# Altium schematic sheet DC116A_AFE4950.SchDoc: AFE
size 431 x 279 mm; Date: Not shown in title block; ApprovedBy: Not shown in title block; CheckedBy: Not shown in title block; Author: Not shown in title block; CompanyName: Not shown in title block; DrawnBy: Midhun Raveendran; Engineer: Midhun Raveendran; Organization: Not shown in title block; Address1: Not shown in title block; Address2: Not shown in title block; Address3: Not shown in title block; Address4: Not shown in title block; DocumentNumber: 2; Revision: Use project parameter SCH_Rev; SheetNumber: 2; SheetTotal: 8; PageSetup: Record=PageOptions|CenterHorizontal=True|CenterVertical=True|PrintScale=1.00|XCorrection=1.00|YCorrection=1.00|PrintKind=0|BorderSize=5000000|LeftOffset=0|BottomOffset=0|Orientation=2|PaperLength=1000|PaperWidth=1000|Scale=100|PaperSource=15|PrintQuality=600|MediaType=1|DitherType=10|PaperKind=Letter|PrintScaleMode=1; CurrentTime: Not shown in title block; CurrentDate: Not shown in title block; Time: Not shown in title block; DocumentFullPathAndName: Not shown in title block; DocumentName: Not shown in title block; ModifiedDate: Not shown in title block; ImagePath: Not shown in title block
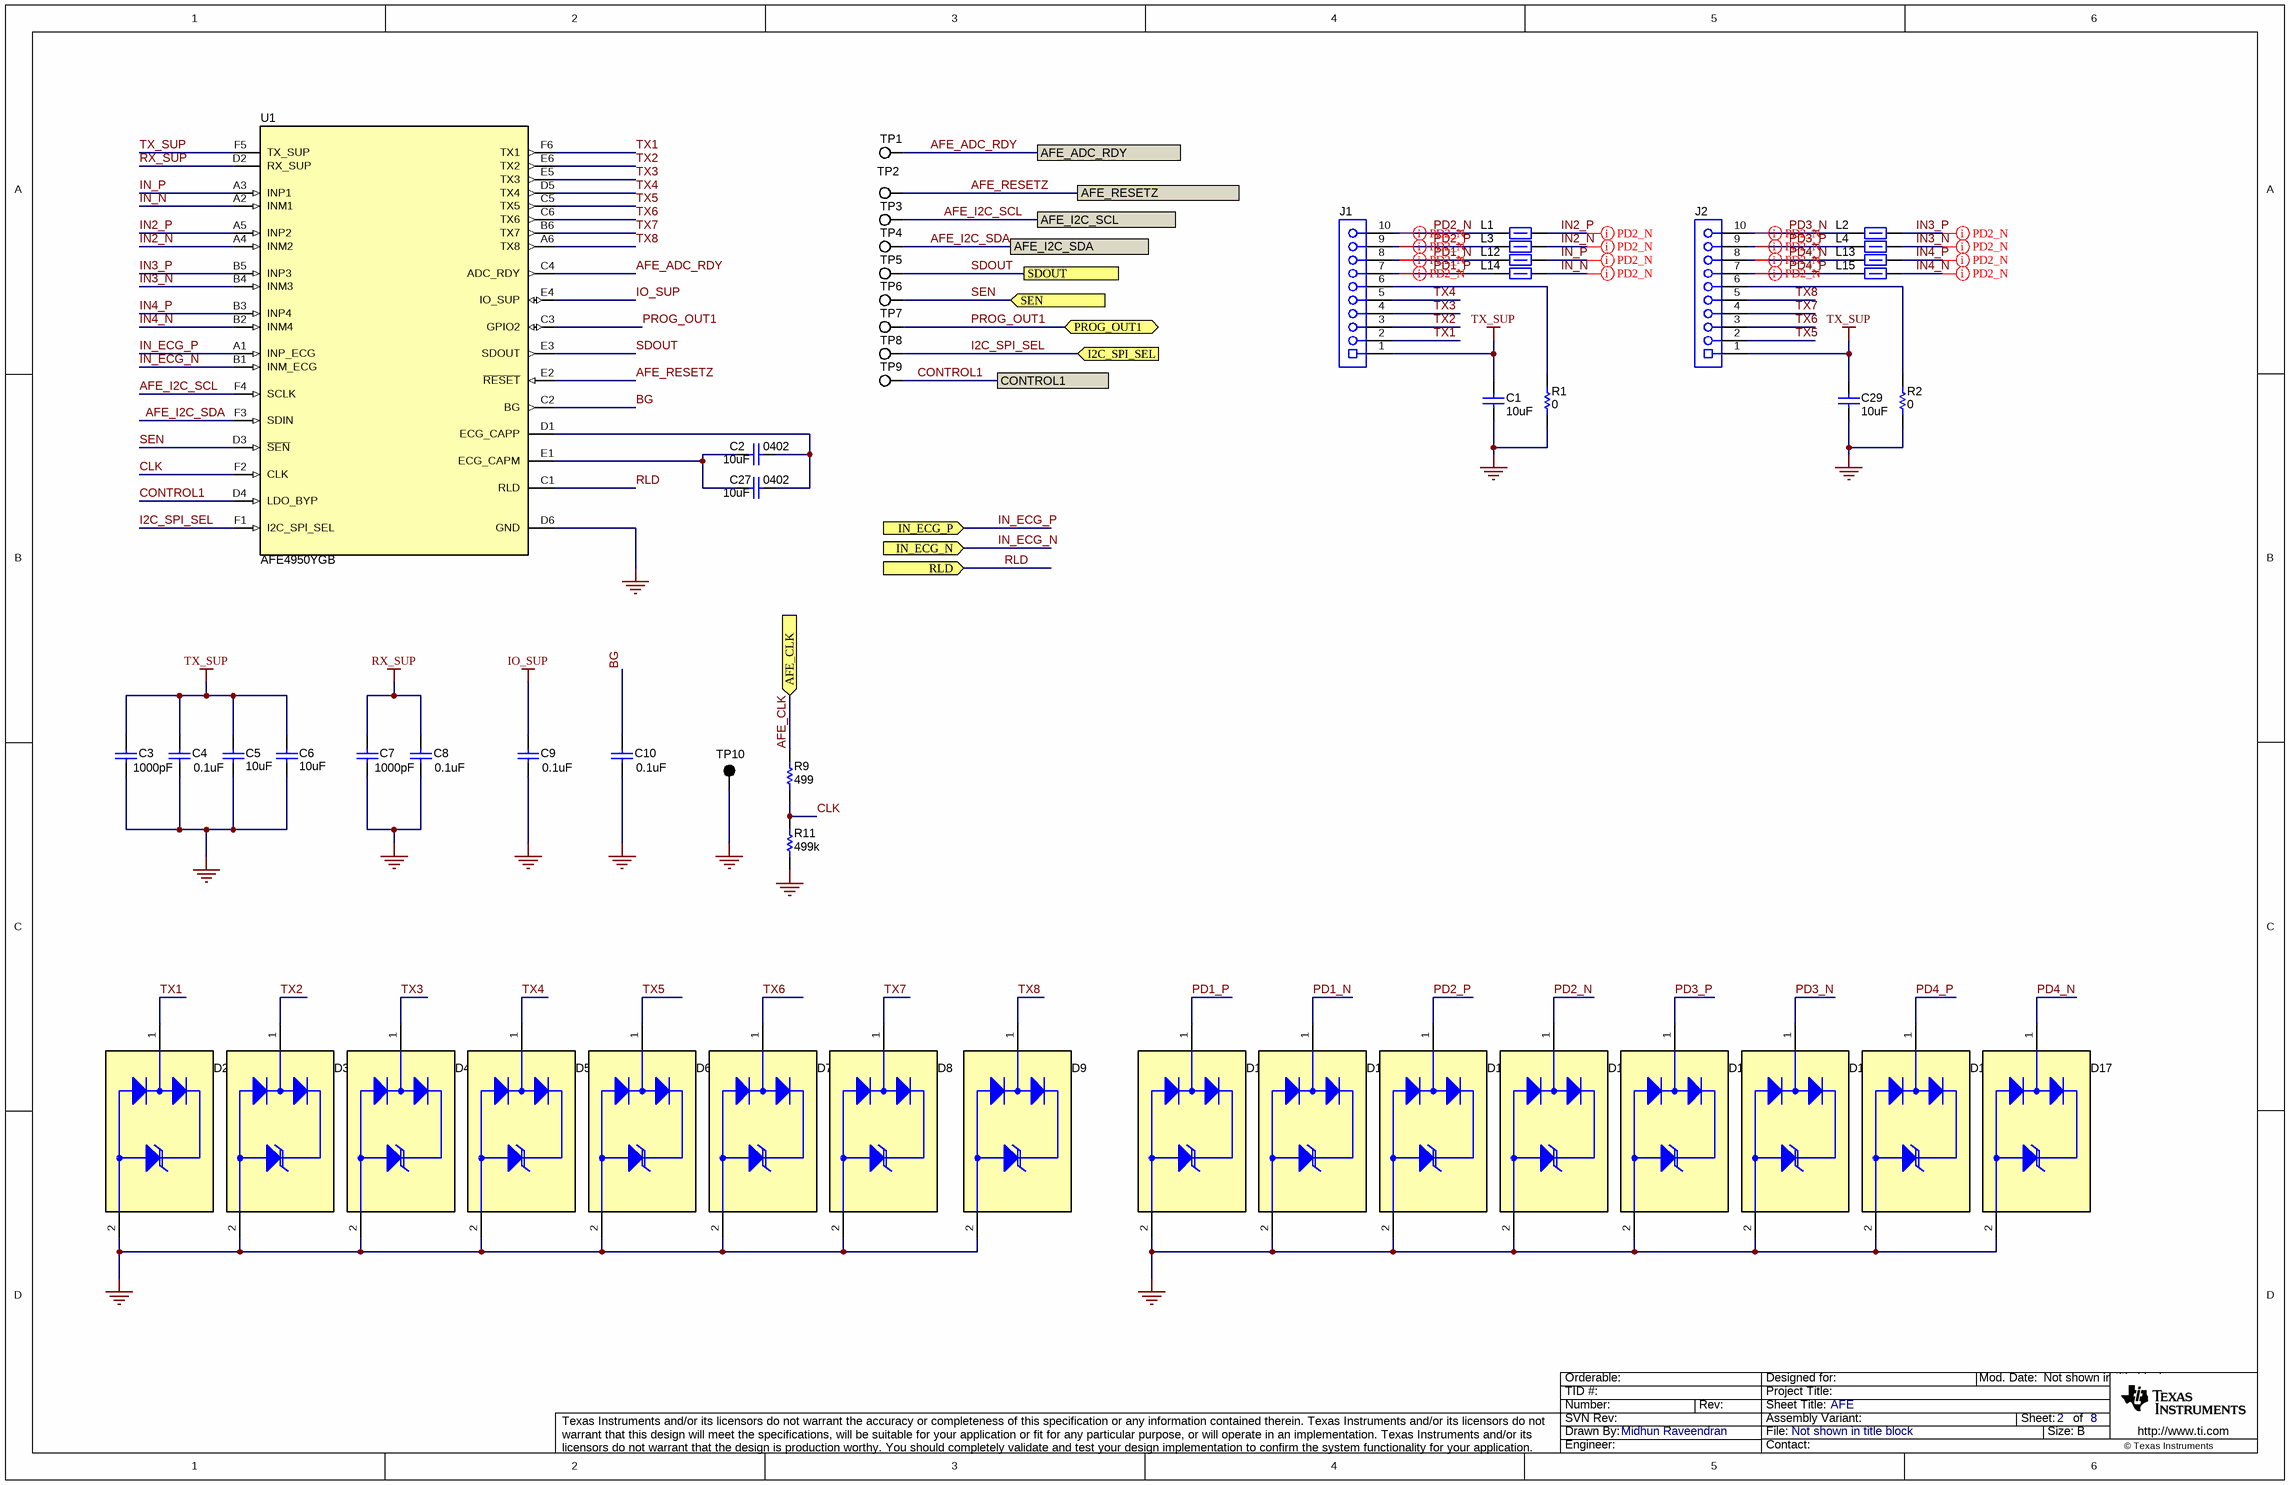
[diagram p0: DC116A_AFE4950.SchDoc]

## Parts
C1  ValueDisplayed: 10uF  [0603]  (hidden comment: Capacitor)
C2  Cap_Case: 0402  ValueDisplayed: 10uF  [0402_070]  (hidden comment: GRM155R60J106ME44D)
C3  ValueDisplayed: 1000pF  [0402]  (hidden comment: C1005X7R1H102M050BE)
C4  ValueDisplayed: 0.1uF  [0402]  (hidden comment: 0402YC104KAT2A)
C5  ValueDisplayed: 10uF  [0603]  (hidden comment: Capacitor)
C6  ValueDisplayed: 10uF  [0603]  (hidden comment: Capacitor)
C7  ValueDisplayed: 1000pF  [0402]  (hidden comment: C1005X7R1H102M050BE)
C8  ValueDisplayed: 0.1uF  [0402]  (hidden comment: 0402YC104KAT2A)
C9  ValueDisplayed: 0.1uF  [0402]  (hidden comment: 0402YC104KAT2A)
C10  ValueDisplayed: 0.1uF  [0402]  (hidden comment: 0402YC104KAT2A)
C27  Cap_Case: 0402  ValueDisplayed: 10uF  [0402_070]  (hidden comment: GRM155R60J106ME44D)
C29  ValueDisplayed: 10uF  [0603]  (hidden comment: Capacitor)
D2  TPD1E04U04DPYR  [DPY0002A]  (value not drawn)
D3  TPD1E04U04DPYR  [DPY0002A]  (value not drawn)
D4  TPD1E04U04DPYR  [DPY0002A]  (value not drawn)
D5  TPD1E04U04DPYR  [DPY0002A]  (value not drawn)
D6  TPD1E04U04DPYR  [DPY0002A]  (value not drawn)
D7  TPD1E04U04DPYR  [DPY0002A]  (value not drawn)
D8  TPD1E04U04DPYR  [DPY0002A]  (value not drawn)
D9  TPD1E04U04DPYR  [DPY0002A]  (value not drawn)
D10  TPD1E04U04DPYR  [DPY0002A]  (value not drawn)
D11  TPD1E04U04DPYR  [DPY0002A]  (value not drawn)
D12  TPD1E04U04DPYR  [DPY0002A]  (value not drawn)
D13  TPD1E04U04DPYR  [DPY0002A]  (value not drawn)
D14  TPD1E04U04DPYR  [DPY0002A]  (value not drawn)
D15  TPD1E04U04DPYR  [DPY0002A]  (value not drawn)
D16  TPD1E04U04DPYR  [DPY0002A]  (value not drawn)
D17  TPD1E04U04DPYR  [DPY0002A]  (value not drawn)
J1  Receptacle_10x1  [CONN_851-43-010-20-001000]  (value not drawn)
J2  Receptacle_10x1  [CONN_851-43-010-20-001000]  (value not drawn)
L1  MMZ1005S182ET000  [MMZ1005-E]  (value not drawn)
L2  MMZ1005S182ET000  [MMZ1005-E]  (value not drawn)
L3  MMZ1005S182ET000  [MMZ1005-E]  (value not drawn)
L4  MMZ1005S182ET000  [MMZ1005-E]  (value not drawn)
L12  MMZ1005S182ET000  [MMZ1005-E]  (value not drawn)
L13  MMZ1005S182ET000  [MMZ1005-E]  (value not drawn)
L14  MMZ1005S182ET000  [MMZ1005-E]  (value not drawn)
L15  MMZ1005S182ET000  [MMZ1005-E]  (value not drawn)
R1  ValueDisplayed: 0  [0201]  (hidden comment: Resistor)
R2  ValueDisplayed: 0  [0201]  (hidden comment: Resistor)
R9  ValueDisplayed: 499  [0402]  (hidden comment: Resistor)
R11  ValueDisplayed: 499k  [0402]  (hidden comment: Resistor)
TP1  5002  [Keystone5002]  (value not drawn)
TP2  5002  [Keystone5002]  (value not drawn)
TP3  5002  [Keystone5002]  (value not drawn)
TP4  5002  [Keystone5002]  (value not drawn)
TP5  5002  [Keystone5002]  (value not drawn)
TP6  5002  [Keystone5002]  (value not drawn)
TP7  5002  [Keystone5002]  (value not drawn)
TP8  5002  [Keystone5002]  (value not drawn)
TP9  5002  [Keystone5002]  (value not drawn)
TP10  5001  [Keystone5001]  (value not drawn)
U1  AFE4950YGB  [YBG0036-C01]

## Ports
AFE_ADC_RDY, AFE_CLK (in), AFE_I2C_SCL, AFE_I2C_SDA, AFE_RESETZ, CONTROL1, I2C_SPI_SEL (in), IN_ECG_N (in), IN_ECG_P (in), PROG_OUT1 (bidir), RLD (in), SDOUT, SEN (in)

## Nets
GND: C1.2 C3.2 C4.1 C5.2 C6.2 C7.2 C8.1 C9.1 C10.1 C29.2 D2.2(GND) D3.2(GND) D4.2(GND) D5.2(GND) D6.2(GND) D7.2(GND) D8.2(GND) D9.2(GND) D10.2(GND) D11.2(GND) D12.2(GND) D13.2(GND) D14.2(GND) D15.2(GND) D16.2(GND) D17.2(GND) R1.2 R2.2 R11.1 TP10.1 U1.D6(GND)
IO_SUP: C9.2 U1.E4(IO_SUP)
RX_SUP: C7.1 C8.2 U1.D2(RX_SUP)
TX_SUP: C1.1 C3.1 C4.2 C5.1 C6.1 C29.1 J1.1 J2.1 U1.F5(TX_SUP)
AFE_ADC_RDY: TP1.1 U1.C4(ADC_RDY) ; port AFE_ADC_RDY
AFE_CLK: R9.2 ; port AFE_CLK
AFE_I2C_SCL: TP3.1 U1.F4(SCLK) ; port AFE_I2C_SCL
AFE_I2C_SDA: TP4.1 U1.F3(SDIN) ; port AFE_I2C_SDA
AFE_RESETZ: TP2.1 U1.E2(~{RESET}) ; port AFE_RESETZ
BG: C10.2 U1.C2(BG)
CLK: R9.1 R11.2 U1.F2(CLK)
CONTROL1: TP9.1 U1.D4(LDO_BYP) ; port CONTROL1
I2C_SPI_SEL: TP8.1 U1.F1(I2C_SPl_SEL) ; port I2C_SPI_SEL
IN2_N: L3.1 U1.A4(INM2)
IN2_P: L1.1 U1.A5(INP2)
IN3_N: L4.1 U1.B4(INM3)
IN3_P: L2.1 U1.B5(INP3)
IN4_N: L15.1 U1.B2(INM4)
IN4_P: L13.1 U1.B3(INP4)
IN_ECG_N: U1.B1(INM_ECG) ; port IN_ECG_N
IN_ECG_P: U1.A1(INP_ECG) ; port IN_ECG_P
IN_N: L14.1 U1.A2(INM1)
IN_P: L12.1 U1.A3(INP1)
PD1_N: D11.1(I/O) J1.8 L12.2
PD1_P: D10.1(I/O) J1.7 L14.2
PD2_N: D13.1(I/O) J1.10 L1.2
PD2_P: D12.1(I/O) J1.9 L3.2
PD3_N: D15.1(I/O) J2.10 L2.2
PD3_P: D14.1(I/O) J2.9 L4.2
PD4_N: D17.1(I/O) J2.8 L13.2
PD4_P: D16.1(I/O) J2.7 L15.2
PROG_OUT1: TP7.1 U1.C3(GPIO2) ; port PROG_OUT1
RLD: U1.C1(RLD) ; port RLD
SDOUT: TP5.1 U1.E3(SDOUT) ; port SDOUT
SEN: TP6.1 U1.D3(~{SEN}) ; port SEN
TX1: D2.1(I/O) J1.2 U1.F6(TX1)
TX2: D3.1(I/O) J1.3 U1.E6(TX2)
TX3: D4.1(I/O) J1.4 U1.E5(TX3)
TX4: D5.1(I/O) J1.5 U1.D5(TX4)
TX5: D6.1(I/O) J2.2 U1.C5(TX5)
TX6: D7.1(I/O) J2.3 U1.C6(TX6)
TX7: D8.1(I/O) J2.4 U1.B6(TX7)
TX8: D9.1(I/O) J2.5 U1.A6(TX8)
NetC2_1: C2.1 C27.1 U1.E1(ECG_CAPM)
NetC2_2: C2.2 C27.2 U1.D1(ECG_CAPP)
NetJ1_6: J1.6 R1.1
NetJ2_6: J2.6 R2.1

## Layout directives
differential pair: IN2_N, IN2_P, IN3_N, IN3_P, IN4_N, IN4_P, IN_N, IN_P, PD1_N, PD1_P, PD2_N, PD2_P, PD3_N, PD3_P, PD4_N, PD4_P

## Notes on the sheet
- Drawn By:
- SVN Rev:
- Number:
- TID #:
- Orderable:
- Rev:
- Sheet Title:
- File:
- Project Title:
- Designed for:
- Assembly Variant:
- Mod. Date:
- Sheet:
- Size:
- of
- B
- http://www.ti.com
- Texas Instruments and/or its licensors do not warrant the accuracy or completeness of this specification or any information contained therein. Texas Instruments and/or its licensors do not warrant that this design will meet the specifications, will be suitable for your application or fit for any particular purpose, or will operate in an implementation. Texas Instruments and/or its licensors do not warrant that the design is production worthy. You should completely validate and test your design implementation to confirm the system functionality for your application.
- Engineer:
- Contact:
- © Texas Instruments

## Library data of the parts
C1 C5 C6 C29 = CMP-0007007-5: CAP, CERM, 10 uF, 25 V, +/- 20%, X5R, 0603; PartNumber: C1608X5R1E106M080AC; Manufacturer: TDK; Polarized: N; Value: 10uF; U/M: EA; Cap_F: 10µF; ESR_ohm: 4.639m; Value1: 0.004639 ohm; VDC_V: 25V; IRMS_A: 2.41407A; TaMin_C: -55°C; TaMax_C: 85°C; SizeArea_mm2: 1.28; SizeAreaWB_mm2: 4.68; SizeX_mm: 1.6; SizeY_mm: 0.8; SizeZ_mm: 1; AEC Category: Q200; CompType: Capacitor; PackageReference: 0603; RoHS: Y; Tolerance_%: 20%; Value2: 25V; MountType: SMT; Technology: Ceramic; TempCo: X5R; Cap_Case: 0603; Published: 2008-06-19; Publisher: Texas Instruments; LatestRevisionDate: 2017-03-09; ComponentLink1Description: Datasheet link; ComponentLink1URL: https://product.tdk.com/en/search/capacitor/ceramic/mlcc/info?part_no=C1608X5R1E106M080AC; Supplier 1: Digi-Key; Supplier Part Number 1: 445-9015-1-ND; Supplier 2: Newark; Supplier Part Number 2: 07W9179; Supplier 3: Mouser; Supplier Part Number 3: 810-C1608X5R1E106M; AEC Qualified: N; AEC Grade: N/A
C2 C27 = CMP-0006535-2: CAP, CERM, 10 uF, 6.3 V, +/- 20%, X5R, 0402; Manufacturer: MuRata; TaMin_C: -55°C; Polarized: N; SizeAreaWB_mm2: 3; Value1: Unknown; U/M: EA; Value: 10uF; TaMax_C: 85°C; SizeZ_mm: 0.7; SizeX_mm: 1; SizeY_mm: 0.5; Value2: 6.3V; Cap_F: 10µF; AEC Category: Q200; Publisher: Texas Instruments; TempCo: X5R; Published: 2008-06-19; RoHS: Y; MountType: SMT; Supplier 1: Mouser; PackageReference: 0402; Tolerance_%: 20%; SizeArea_mm2: 0.5; CompType: Capacitor; LatestRevisionDate: 2017-03-09; PartNumber: GRM155R60J106ME44D; AEC Qualified: ?; VDC_V: 6.3V; ComponentLink1Description: Datasheet link; Supplier Part Number 1: 81-GRM155R60J106ME4D; Technology: Ceramic; ComponentLink1URL: https://sps06.itg.ti.com/sites/KMS/crossdivteams/altium/docs/ComponentDatasheets/grm155r60j106me44d.pdf
C3 C7 = CMP-0006296-2: CAP, CERM, 1000 pF, 50 V, +/- 20%, X7R, 0402; Manufacturer: TDK; TaMin_C: -55°C; Polarized: N; SizeAreaWB_mm2: 3; Value1: Unknown; U/M: EA; Value: 1000pF; TaMax_C: 125°C; SizeZ_mm: 0.6; SizeX_mm: 1; SizeY_mm: 0.5; Value2: 50V; Cap_F: 1nF; AEC Category: Q200; Supplier Part Number 2: 92Y5760; Publisher: Texas Instruments; Supplier 2: Newark; Supplier Part Number 3: 810-C1005X7R1H102MBE; TempCo: X7R; Supplier 3: Mouser; Published: 2008-06-19; RoHS: Y; MountType: SMT; Supplier 1: Digi-Key; PackageReference: 0402; Tolerance_%: 20%; Cap_Case: 0402; SizeArea_mm2: 0.5; CompType: Capacitor; LatestRevisionDate: 2017-03-09; PartNumber: C1005X7R1H102M050BE; AEC Qualified: N; VDC_V: 50V; ComponentLink1Description: Datasheet link; AEC Grade: N/A; Supplier Part Number 1: 445-173775-1-ND; Technology: Ceramic; ComponentLink1URL: https://product.tdk.com/info/en/catalog/datasheets/mlcc_commercial_soft_en.pdf
C4 C8-C10 = CMP-0006201-2: CAP, CERM, 0.1 uF, 16 V, +/- 10%, X7R, 0402; Manufacturer: AVX; TaMin_C: -55°C; Polarized: N; SizeAreaWB_mm2: 3; Value1: Unknown; U/M: EA; Value: 0.1uF; TaMax_C: 125°C; SizeZ_mm: 0.6; SizeX_mm: 1; SizeY_mm: 0.5; Value2: 16V; Cap_F: 100nF; AEC Category: Q200; Supplier Part Number 2: 09R7024; Publisher: Texas Instruments; Supplier 2: Newark; Supplier Part Number 3: 581-0402YC104KAT2A; TempCo: X7R; Supplier 3: Mouser; Published: 2008-06-19; RoHS: Y; MountType: SMT; Supplier 1: Digi-Key; PackageReference: 0402; Tolerance_%: 10%; Cap_Case: 0402; SizeArea_mm2: 0.5; CompType: Capacitor; LatestRevisionDate: 2017-03-09; PartNumber: 0402YC104KAT2A; AEC Qualified: N; VDC_V: 16V; ComponentLink1Description: Datasheet link; AEC Grade: N/A; Supplier Part Number 1: 478-7888-1-ND; Technology: Ceramic; ComponentLink1URL: http://catalogs.avx.com/SurfaceMount.pdf
D2-D17 = CMP-0073604-3: 1-Channel ESD Protection Diode With Low Dynamic Resistance for HDMI 2.0 and USB 3.0, DPY0002A (X1SON-2); Manufacturer: Texas Instruments; Alternate PartNumber: TPD1E04U04DPYT; SizeX_mm: 1.0; SizeAreaWB_mm2: 3.2; SizeArea_mm2: 0.6; CompType: IC; Rating: Catalog; AEC Category: Q200; SizeZ_mm: 0.45; MountType: SMT; PartNumber: TPD1E04U04DPYR; ComponentLink1URL: http://www.ti.com/lit/ds/symlink/tpd1e04u04.pdf; PackageDescription: X1SON-2; Operating Temperature Range: -40 to 125 C; SizeY_mm: 0.6; PackageReference: DPY0002A; Alternate Manufacturer: Texas Instruments; ComponentLink3Description: Online Datasheet; ComponentLink3URL: http://www.ti.com/product/tpd1e04u04/datasheet; ComponentLink2URL: http://www.ti.com/product/tpd1e04u04; ComponentLink1Description: Datasheet Link; ComponentLink2Description: Product Folder
J1 J2 = CMP-0055062-1: Receptacle, 50mil, 10x1, Gold, R/A, TH; PartNumber: 851-43-010-20-001000; Manufacturer: Mill-Max; CompType: Socket Strip; CNHeader: FALSE; CT: TRUE; Green_Lifecycle: Active; Green_REACh: Passed; PackageReference: receptacle 10x1, 50mil; RoHS: Y; MountType: TH; ComponentLink1Description: Datasheet URL; ComponentLink1URL: https://www.mill-max.com/assets/pdfs/036.PDF; Publisher: Texas Instruments; LatestRevisionDate: 26/05/2017; Green_EU RoHS-2: Incomplete; Green_EU RoHS: Passed with Exemption
L1-L4 L12-L15 = CMP-0080017-1: Inductor, Ferrite Bead, Ferrite, 0.2 A, 2.1 ohm, SMD; Manufacturer: TDK; SizeAreaWB_mm2: 3; SizeArea_mm2: 0.5; AEC Qualified: N; AEC Category: Q200; SizeZ_mm: 0.55; Imax_A: 200mA; Value2: 0.2A; Value1: 2.1 ohm; DCR_ohm: 2.1; SizeX_mm: 1; ComponentLink1Description: Datasheet link; RoHS: Y; Supplier Part Number 3: 810-MMZ1005S182ET000; Supplier 1: Digi-Key; PackageReference: 1x0.5mm; Technology: Ferrite Bead; PartNumber: MMZ1005S182ET000; Supplier Part Number 2: 88T9797; Supplier 2: Newark; AEC Grade: N/A; SizeY_mm: 0.5; ComponentLink1URL: https://product.tdk.com/info/en/catalog/datasheets/beads_commercial_signal_mmz1005-e_en.pdf; CompType: Inductor; MountType: SMT; Supplier Part Number 1: 445-6748-1-ND; Material: Ferrite; Supplier 3: Mouser
R1 R2 = CMP-0027011-4: RES, 0, 5%, 0.05 W, AEC-Q200 Grade 1, 0201; PartNumber: ERJ-1GE0R00C; Manufacturer: Panasonic; Value: 0; Value_Code: 0000; Power_W: 50mW; Value2: 0.05W; VDC_V: 15V; TempCo: 600 ppm/C; SizeArea_mm2: 0.18; SizeX_mm: 0.6; SizeY_mm: 0.3; SizeZ_mm: 0.26; EIA_Code: E24; AEC Category: Q200; AEC Qualified: Y; AEC Grade: 1; SizeAreaWB_mm2: 2.08; CompType: Resistor; PackageReference: 0201; RoHS: Y; Res_ohm: 0; Tolerance_%: 5%; Value1: 5%; MountType: SMT; Technology: Thick Film; ComponentLink1Description: Datasheet link; ComponentLink1URL: https://industrial.panasonic.com/cdbs/www-data/pdf/RDA0000/AOA0000C301.pdf; Supplier 1: Digi-Key; Supplier Part Number 1: P0.0AGCT-ND; Supplier 2: Newark; Supplier Part Number 2: 53W4043; Supplier 3: Mouser; Supplier Part Number 3: 667-ERJ-1GE0R00C
R9 = CMP-0026402-2: RES, 499, 1%, 0.063 W, AEC-Q200 Grade 0, 0402; PartNumber: CRCW0402499RFKED; Manufacturer: Vishay-Dale; Value: 499; Value_Code: 499R; Power_W: 63mW; Value2: 0.063W; VDC_V: 50V; TempCo: 100 ppm/C; EIA_Code: E96; SizeArea_mm2: 0.5; SizeX_mm: 1; SizeZ_mm: 0.6; AEC Category: Q200; AEC Qualified: Y; AEC Grade: 0; CompType: Resistor; PackageReference: 0402; RoHS: E; Res_ohm: 499; Tolerance_%: 1%; Value1: 1%; MountType: SMT; Technology: Thick Film; ComponentLink1Description: Datasheet link; ComponentLink1URL: http://www.vishay.com/docs/20035/dcrcwe3.pdf; Supplier 1: Digi-Key; Supplier Part Number 1: 541-499LCT-ND; Supplier 2: Newark; Supplier Part Number 2: 52K7117; Supplier 3: Mouser; Supplier Part Number 3: 71-CRCW0402-499-E3; SizeY_mm: 0.5
R11 = CMP-0026401-2: RES, 499 k, 1%, 0.063 W, AEC-Q200 Grade 0, 0402; PartNumber: CRCW0402499KFKED; Manufacturer: Vishay-Dale; Value: 499k; Power_W: 63mW; Value2: 0.063W; VDC_V: 50V; TempCo: 100 ppm/C; EIA_Code: E96; SizeArea_mm2: 0.5; SizeX_mm: 1; SizeZ_mm: 0.6; AEC Category: Q200; AEC Qualified: Y; AEC Grade: 0; CompType: Resistor; PackageReference: 0402; RoHS: E; Res_ohm: 499k; Value_Code: 499k; Tolerance_%: 1%; Value1: 1%; MountType: SMT; Technology: Thick Film; ComponentLink1Description: Datasheet link; ComponentLink1URL: http://www.vishay.com/docs/20035/dcrcwe3.pdf; Supplier 1: Digi-Key; Supplier Part Number 1: 541-499KLCT-ND; Supplier 2: Newark; Supplier Part Number 2: 52K7116; Supplier 3: Mouser; Supplier Part Number 3: 71-CRCW0402-499K-E3; SizeY_mm: 0.5
TP1-TP9 = CMP-0055139-1: Test Point, Miniature, White, TH; Manufacturer: Keystone; ContactFinish: Silver; CNHeader: FALSE; CT: TRUE; Green_Lifecycle: Active; Green_REACh: Passed; PartNumber: 5002; PackageReference: White Miniature Testpoint; CompType: Test Point; RoHS: Y; MountType: TH; ComponentLink1Description: Datasheet URL; ComponentLink1URL: http://www.keyelco.com/userAssets/file/M60-2p60.pdf; Publisher: Texas Instruments; LatestRevisionDate: 26/05/2017; Supplier 1: Digi-Key; Supplier Part Number 1: 36-5002-ND; Supplier 2: Newark; Supplier Part Number 2: 82H9632; Supplier 3: Mouser; Supplier Part Number 3: 534-5002; Color: White; Green_EU RoHS-2: Passed; Green_EU RoHS: Passed
TP10 = CMP-0055138-1: Test Point, Miniature, Black, TH; Manufacturer: Keystone; ContactFinish: Silver; CNHeader: FALSE; CT: TRUE; Green_Lifecycle: Active; Green_REACh: Passed; PartNumber: 5001; PackageReference: Black Miniature Testpoint; CompType: Test Point; RoHS: Y; MountType: TH; ComponentLink1Description: Datasheet URL; ComponentLink1URL: http://www.keyelco.com/userAssets/file/M60-2p60.pdf; Publisher: Texas Instruments; LatestRevisionDate: 26/05/2017; Supplier 1: Digi-Key; Supplier Part Number 1: 36-5001-ND; Supplier 2: Mouser; Supplier Part Number 2: 534-5001; Color: Black; Green_EU RoHS-2: Incomplete; Green_EU RoHS: Passed
U1 = CMP-0860871-1: Ultra-Small, Integrated AFE for Wearable Optical Heart-Rate Monitoring, SpO2 and Electrical Bio-sensing, YBG0036-C01 (DSBGA-36); Alternate Manufacturer: Texas Instruments; CompType: IC; SizeY_mm: 2.565; AEC Qualified: N; SizeX_mm: 2.465; AEC Category: Q200; SizeZ_mm: 0.5; SizeArea_mm2: 6.322725; SizeAreaWB_mm2: 12.352725; ComponentLink2Description: Product Folder; ComponentLink1Description: Datasheet Link; PartNumber: AFE4950YGB; ComponentLink3URL: http://www.ti.com/product/afe4950/datasheet; ComponentLink2URL: http://www.ti.com/product/afe4950; ComponentLink3Description: Online Datasheet; ComponentLink1URL: http://www.ti.com/lit/ds/symlink/afe4950.pdf; MountType: SMT; Manufacturer: Texas Instruments; PackageReference: YBG0036-C01; PackageDescription: DSBGA-36